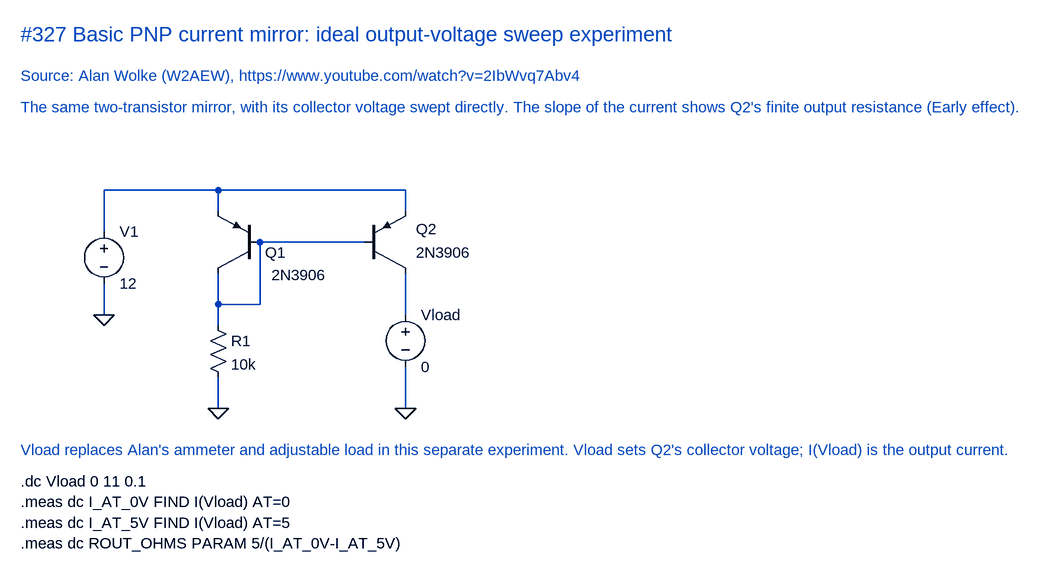
[diagram p0: schematic Basic mirror voltage-sweep experiment.asc]
Basic mirror voltage-sweep experiment.asc, the LTspice schematic file:
Version 4.1
SHEET 1 1744 880
WIRE 336 272 160 272
WIRE 624 272 336 272
WIRE 336 304 336 272
WIRE 624 304 624 272
WIRE 160 336 160 272
WIRE 560 352 400 352
WIRE 336 448 336 400
WIRE 400 448 400 352
WIRE 400 448 336 448
WIRE 160 464 160 416
WIRE 624 464 624 400
WIRE 336 480 336 448
WIRE 336 608 336 560
WIRE 624 608 624 544
FLAG 160 464 0
FLAG 336 608 0
FLAG 624 608 0
SYMBOL voltage 160 320 R0
SYMATTR InstName V1
SYMATTR Value 12
SYMBOL pnp 400 400 R180
WINDOW 0 -40 32 Left 2
WINDOW 3 -103 -3 Left 2
SYMATTR InstName Q1
SYMATTR Value 2N3906
SYMBOL pnp 560 400 M180
WINDOW 0 80 68 Left 2
WINDOW 3 80 32 Left 2
SYMATTR InstName Q2
SYMATTR Value 2N3906
SYMBOL res 320 464 R0
SYMATTR InstName R1
SYMATTR Value 10k
SYMBOL voltage 624 448 R0
SYMATTR InstName Vload
SYMATTR Value 0
TEXT 32 32 Left 3 ;#327 Basic PNP current mirror: ideal output-voltage sweep experiment
TEXT 32 96 Left 2 ;Source: Alan Wolke (W2AEW), https://www.youtube.com/watch?v=2IbWvq7Abv4
TEXT 32 144 Left 2 ;The same two-transistor mirror, with its collector voltage swept directly. The slope of the current shows Q2's finite output resistance (Early effect).
TEXT 32 672 Left 2 ;Vload replaces Alan's ammeter and adjustable load in this separate experiment. Vload sets Q2's collector voltage; I(Vload) is the output current.
TEXT 32 720 Left 2 !.dc Vload 0 11 0.1
TEXT 32 752 Left 2 !.meas dc I_AT_0V FIND I(Vload) AT=0
TEXT 32 784 Left 2 !.meas dc I_AT_5V FIND I(Vload) AT=5
TEXT 32 816 Left 2 !.meas dc ROUT_OHMS PARAM 5/(I_AT_0V-I_AT_5V)

The netlist it stands for:
* Basic mirror voltage-sweep experiment.asc
V1 N001 0 12
Q1 N002 N002 N001 0 2N3906
Q2 N003 N002 N001 0 2N3906
R1 N002 0 10k
Vload N003 0 0
.model NPN NPN
.model PNP PNP
.lib standard.bjt
* #327 Basic PNP current mirror: ideal output-voltage sweep experiment
* Source: Alan Wolke (W2AEW), https://www.youtube.com/watch?v=2IbWvq7Abv4
* The same two-transistor mirror, with its collector voltage swept directly. The slope of the current shows Q2's finite output resistance (Early effect).
* Vload replaces Alan's ammeter and adjustable load in this separate experiment. Vload sets Q2's collector voltage; I(Vload) is the output current.
.dc Vload 0 11 0.1
.meas dc I_AT_0V FIND I(Vload) AT=0
.meas dc I_AT_5V FIND I(Vload) AT=5
.meas dc ROUT_OHMS PARAM 5/(I_AT_0V-I_AT_5V)
.backanno
.end